# Altium project Powermodule-v7.0.3.PrjPcb (part 2 of 2)

## Sheet Power_Section.SchDoc
size 420 x 297 mm; SheetNumber: 2; SheetTotal: 6
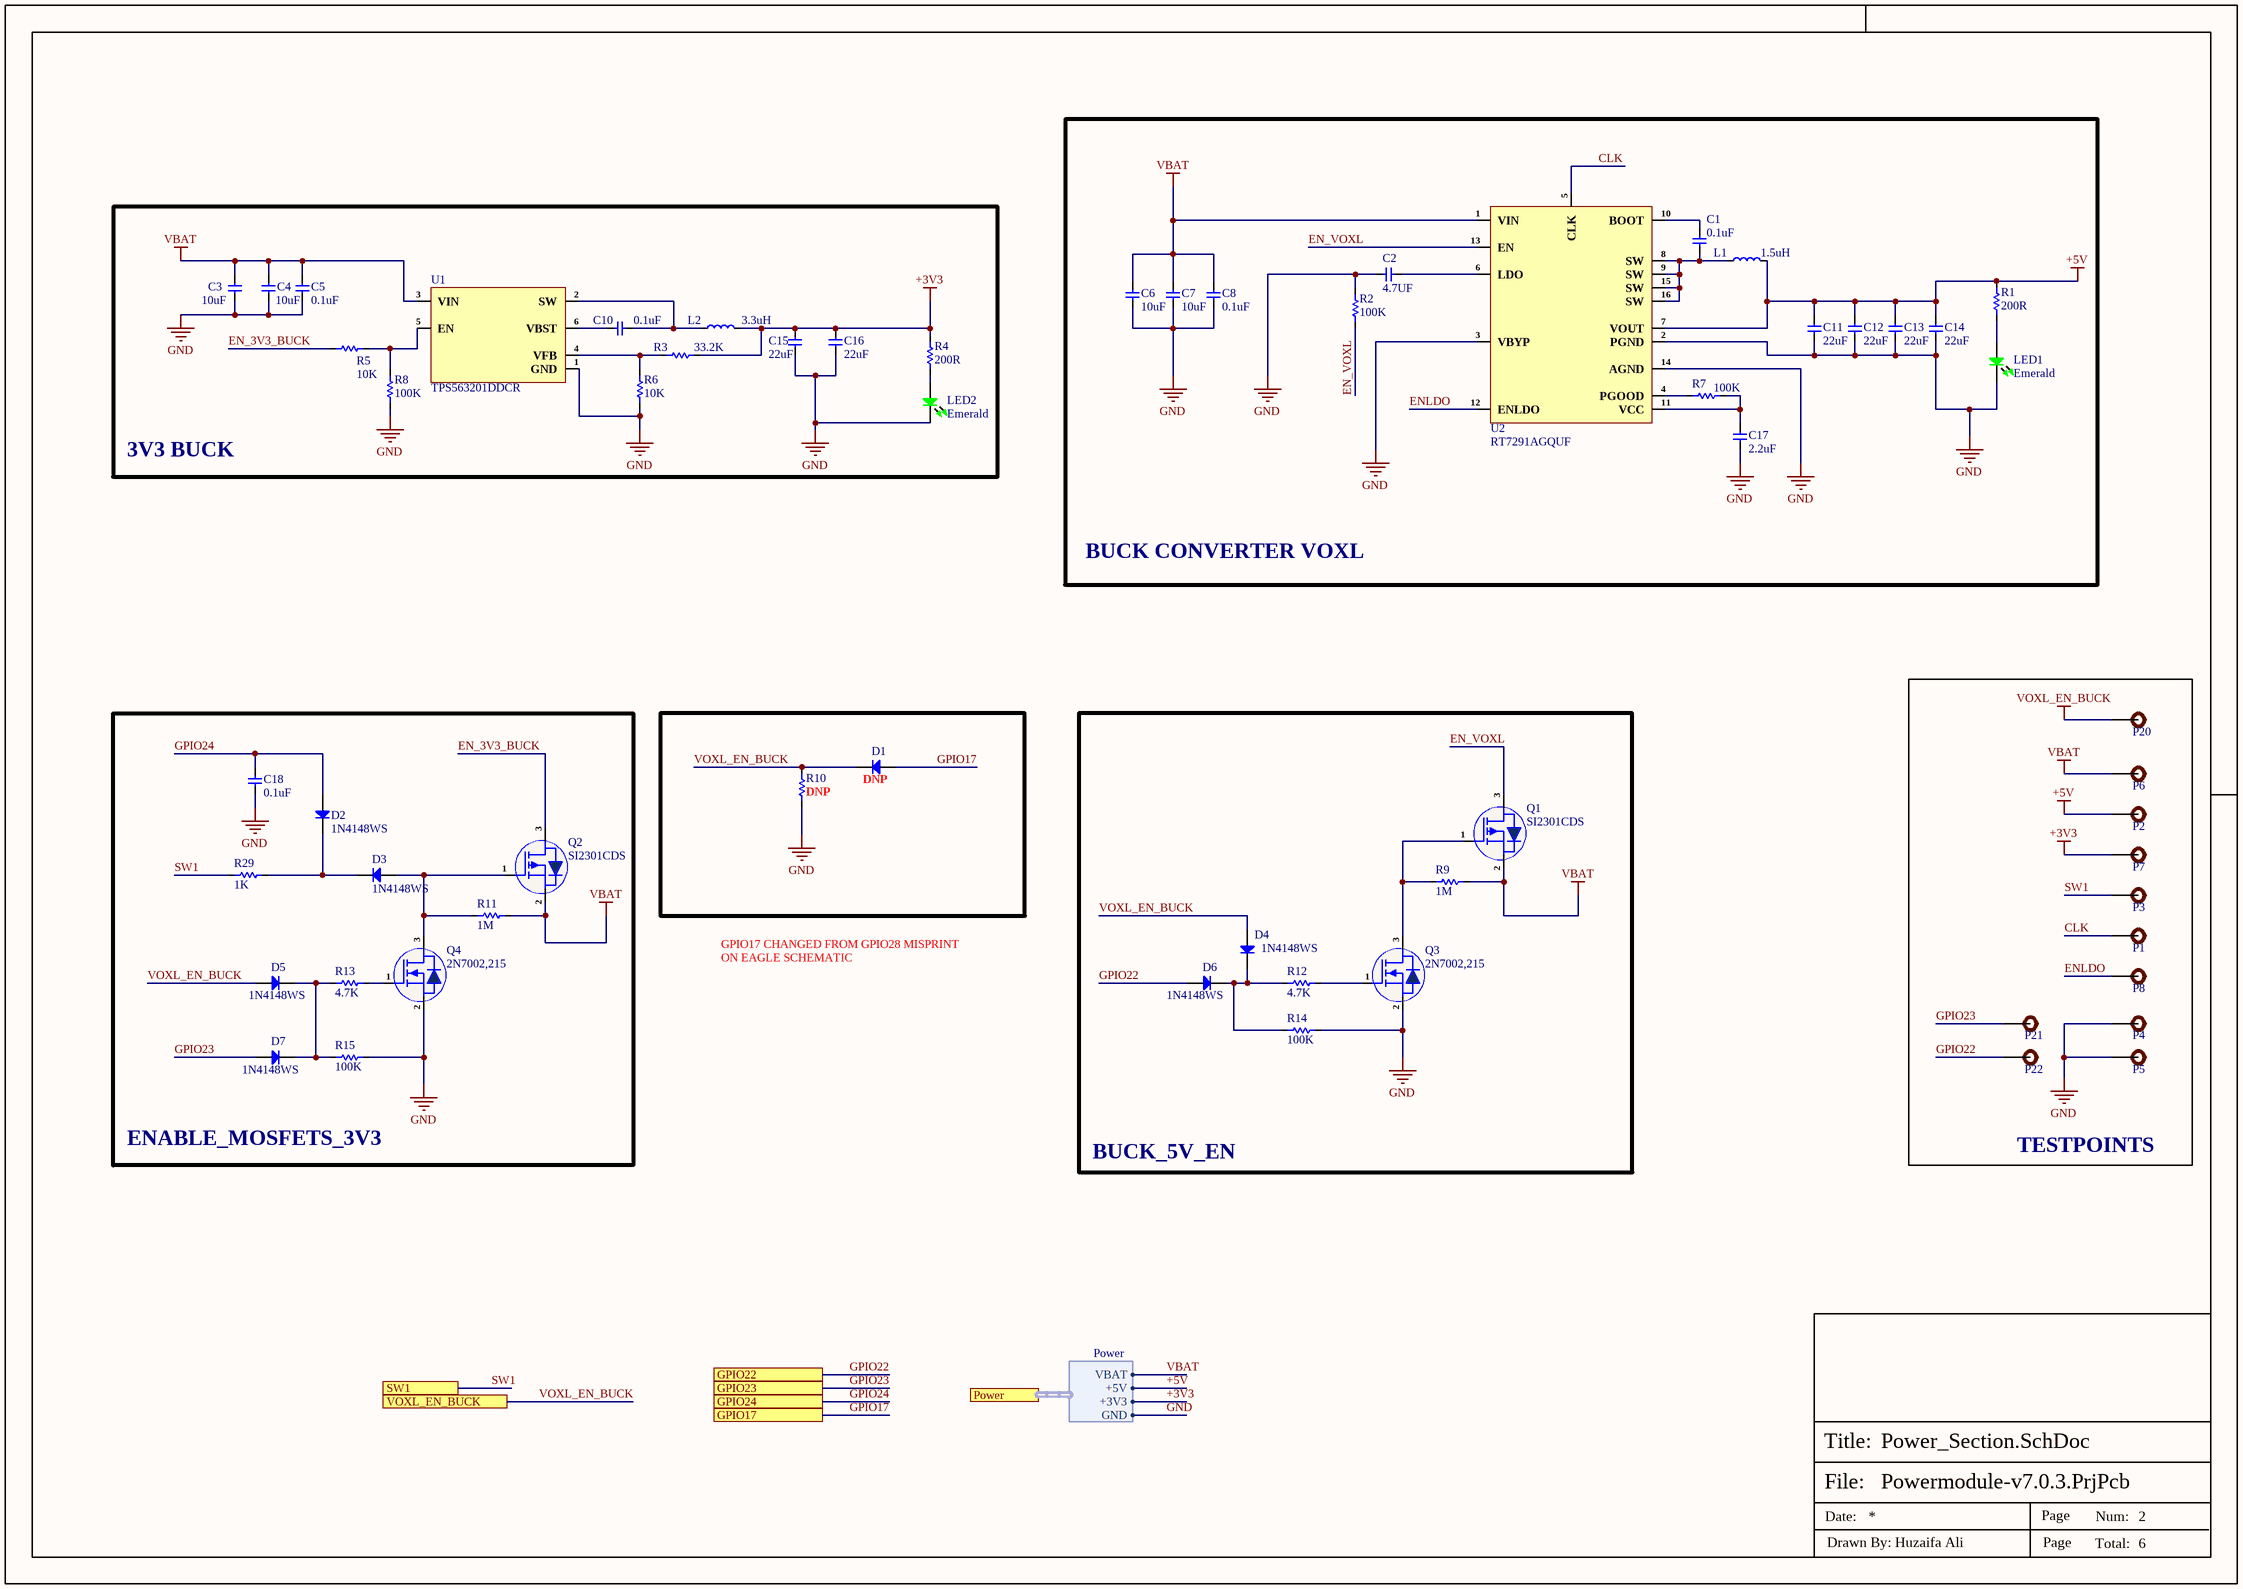
[diagram p4: Power_Section.SchDoc]

### Parts
C1  0.1uF  [Cap-0603]
C2  4.7UF  [Cap-0603]
C3  10uF  [Cap-0603]
C4  10uF  [Cap-0603]
C5  0.1uF  [Cap-0603]
C6  10uF  [Cap-0603]
C7  10uF  [Cap-0603]
C8  0.1uF  [Cap-0603]
C10  0.1uF  [Cap-0603]
C11  22uF  [Cap-0603]
C12  22uF  [Cap-0603]
C13  22uF  [Cap-0603]
C14  22uF  [Cap-0603]
C15  22uF  [Cap-0603]
C16  22uF  [Cap-0603]
C17  2.2uF  [CAP-0603]
C18  0.1uF  [Cap-0603]
D1  DNP  [SOD-323]
D2  1N4148WS  [SOD-323]
D3  1N4148WS  [SOD-323]
D4  1N4148WS  [SOD-323]
D5  1N4148WS  [SOD-323]
D6  1N4148WS  [SOD-323]
D7  1N4148WS  [SOD-323]
L1  1.5uH  [HA72L-06301R5LFTR]
L2  3.3uH  [VLS3012HBX-3R3M]
LED1  Emerald  [LED-0603]
LED2  Emerald  [LED-0603]
P1  TEST POINT  [Test-point]  (value not drawn)
P2  TEST POINT  [Test-point]  (value not drawn)
P3  TEST POINT  [Test-point]  (value not drawn)
P4  TEST POINT  [Test-point]  (value not drawn)
P5  TEST POINT  [Test-point]  (value not drawn)
P6  TEST POINT  [Test-point]  (value not drawn)
P7  TEST POINT  [Test-point]  (value not drawn)
P8  TEST POINT  [Test-point]  (value not drawn)
P20  TEST POINT  [Test-point]  (value not drawn)
P21  TEST POINT  [Test-point]  (value not drawn)
P22  TEST POINT  [Test-point]  (value not drawn)
Q1  SI2301CDS  [SOT-23]
Q2  SI2301CDS  [SOT-23]
Q3  2N7002,215  [SOT-23]
Q4  2N7002,215  [SOT-23]
R1  200R  [Res-0603]
R2  100K  [Res-0603]
R3  33.2K  [Res-0603]
R4  200R  [Res-0603]
R5  10K  [Res-0603]
R6  10K  [Res-0603]
R7  100K  [Res-0603]
R8  100K  [Res-0603]
R9  1M  [Res-0603]
R10  DNP  [Res-0201]
R11  1M  [Res-0603]
R12  4.7K  [Res-0603]
R13  4.7K  [Res-0603]
R14  100K  [Res-0603]
R15  100K  [Res-0603]
R29  1K  [Res-0603]
U1  TPS563201DDCR  [SOT-23-6 THIN]
U2  RT7291AGQUF  [QFN-16(3x3) RT7291AGQUF]

### Blocks framed on the sheet
BUCK CONVERTER VOXL: C1 C2 C6-C8 C11-C14 C17 L1 LED1 R1 R2 R7 U2
3V3 BUCK: C3-C5 C10 C15 C16 L2 LED2 R3-R6 R8 U1
TESTPOINTS: P1-P8 P20-P22
ENABLE_MOSFETS_3V3: C18 D2 D3 D5 D7 Q2 Q4 R11 R13 R15 R29
BUCK_5V_EN: D4 D6 Q1 Q3 R9 R12 R14

### Ports
GPIO17 (see Top-Sheet[2C], Controller_Section[1D]), GPIO22 (see Top-Sheet[2C], Controller_Section[1D]), GPIO23 (see Top-Sheet[2C], Controller_Section[1D]), GPIO24 (see Top-Sheet[2C], Controller_Section[1D]), Power (harness Power, see Top-Sheet[1C], Connector_Section[4D], Controller_Section[2D], FlashMemory_Section[1D], WiFiModule_Section[2D]), SW1 (see Top-Sheet[1C], Connector_Section[1D]), VOXL_EN_BUCK (see Top-Sheet[1C], Connector_Section[2D])

### Harnesses
Power: +5V, +3V3, GND, VBAT

### Nets
+3V3: C15.2 C16.2 L2.2 P7.1 R3.2 R4.2 ; port Power.+3V3
+5V: C11.2 C12.2 C13.2 C14.2 L1.2 P2.1 R1.2 U2.7(VOUT) ; port Power.+5V
GND: C2.1 C3.1 C4.1 C5.1 C6.1 C7.1 C8.1 C11.1 C12.1 C13.1 C14.1 C15.1 C16.1 C17.1 C18.1 LED1.2 LED2.2 P4.1 P5.1 Q3.2(S) Q4.2(S) R2.2 R6.2 R8.1 R10.1 R14.2 R15.2 U1.1(GND) U2.2(PGND) U2.3(VBYP) U2.14(AGND) ; port Power.GND
VBAT: C3.2 C4.2 C5.2 C6.2 C7.2 C8.2 P6.1 Q1.2(S) Q2.2(S) R9.2 R11.2 U1.3(VIN) U2.1(VIN) ; port Power.VBAT
VOXL_EN_BUCK: D1.1(K) D4.2(A) D5.2(A) P20.1 R10.2 ; port VOXL_EN_BUCK
CLK: P1.1 U2.5(CLK)
EN_3V3_BUCK: Q2.3(D) R5.1
EN_VOXL: Q1.3(D) R2.1 U2.13(EN)
ENLDO: P8.1 U2.12(ENLDO)
GPIO17: D1.2(A) ; port GPIO17
GPIO22: D6.2(A) P22.1 ; port GPIO22
GPIO23: D7.2(A) P21.1 ; port GPIO23
GPIO24: C18.2 D2.2(A) ; port GPIO24
SW1: P3.1 R29.1 ; port SW1
NetC1_1: C1.1 L1.1 U2.8(SW) U2.9(SW) U2.15(SW) U2.16(SW)
NetC1_2: C1.2 U2.10(BOOT)
NetC2_2: C2.2 U2.6(LDO)
NetC10_1: C10.1 L2.1 U1.2(SW)
NetC10_2: C10.2 U1.6(VBST)
NetC17_2: C17.2 R7.2 U2.11(VCC)
NetD2_1: D2.1(K) D3.1(K) R29.2
NetD3_2: D3.2(A) Q2.1(G) Q4.3(D) R11.1
NetD4_1: D4.1(K) D6.1(K) R12.1 R14.1
NetD5_1: D5.1(K) D7.1(K) R13.1 R15.1
NetLED1_1: LED1.1 R1.1
NetLED2_1: LED2.1 R4.1
NetQ1_1: Q1.1(G) Q3.3(D) R9.1
NetQ3_1: Q3.1(G) R12.2
NetQ4_1: Q4.1(G) R13.2
NetR3_1: R3.1 R6.1 U1.4(VFB)
NetR5_2: R5.2 R8.2 U1.5(EN)
NetR7_1: R7.1 U2.4(PGOOD)

### Notes on the sheet
- GPIO17 CHANGED FROM GPIO28 MISPRINT ON EAGLE SCHEMATIC
- File:
- Title:
- Date:
- Page
- Num:
- Total:
- Drawn By: Huzaifa Ali

### Library data of the parts
C1 C5 C8 C10 C18 = CL10B104KB8NNNC: CAP CER 0.1UF 50V X7R 0603; Manufacturer: Samsung; Material: Ceramic; Capacitance: 100nF; Tolerance: 10%; Supplier 1: Digi-Key; Manufacturer Part Number: CL10B104KB8NNNC; RoHS: Yes; Category: Ceramic Capacitors; Stock 1: 3998791; Pricing 1: 1=0.10000, 10=0.03000, 50=0.01640, 100=0.01340, 500=0.00954, 1000=0.00750 (USD); Mount: Surface Mount; Case/Package: 0603; Case Code (Metric): 1608; Case Code (Imperial): 0603; Contact Plating: Tin; Min Operating Temperature: -55°C; Max Operating Temperature: 125°C; Dielectric: X7R; Voltage Rating: 50V; Package Quantity: 1; Packaging: Tape and Reel; Voltage: 50V; Voltage Rating (DC): 50V; Series: CL; Construction: Flat; Length: 1.6mm; Width: 0.031inch; Height: 0.8mm; Depth: 0.8mm; Thickness: 0.035inch; Radiation Hardening: No; Lead Free: Lead Free; RoHS Compliant: Yes; ComponentLink1URL: https://datasheet.ciiva.com/25803/cl10b104kb8nnnc-25803393.pdf?src-supplier=Digi-Key; ComponentLink1Description: https://datasheet.ciiva.com/25803/cl10b104kb8nnnc-25803393.pdf?src-supplier=Digi-Key; ComponentLink2URL: https://datasheet.ciiva.com/26838/getdatasheetpartid-89097-26838411.pdf?src-supplier=Verical; ComponentLink2Description: https://datasheet.ciiva.com/26838/getdatasheetpartid-89097-26838411.pdf?src-supplier=Verical; ComponentLink3URL: https://datasheet.ciiva.com/29198/456651-da-01-en-vs-kondensator-0605-29198839.pdf?src-supplier=Conrad; ComponentLink3Description: https://datasheet.ciiva.com/29198/456651-da-01-en-vs-kondensator-0605-29198839.pdf?src-supplier=Conrad; Supplier Part Number 1: 1276-1000-1-ND; LCSC Part Number: C1591
C2 = CL10A475KA8NQNC: CAP CER 4.7UF 25V X5R 0603; Manufacturer: Samsung; Tolerance: 10%; Supplier 1: Digi-Key; Manufacturer Part Number: CL10A475KA8NQNC; Stock 1: 2252340; Pricing 1: 1=0.37, 10=0.255, 100=0.1528, 500=0.11456, 1000=0.09675 (USD); Mount: Surface Mount; Case/Package: 0603; Case Code (Metric): 1608; Case Code (Imperial): 0603; Contact Plating: Tin; Min Operating Temperature: -55°C; Max Operating Temperature: 85°C; Package Quantity: 1; Packaging: Tape and Reel; Capacitance: 4.7uF; Voltage Rating: 25V; Dielectric: X5R; Termination: Wraparound; Length: 1.6mm; Width: 0.031inch; Thickness: 0.035inch; Depth: 0.8mm; Lead Free: Lead Free; ComponentLink1URL: http://www.samsungsem.com/kr/support/product-search/mlcc/CL10A475KA8NQNC.jsp?src-supplier=Digi-Key; ComponentLink1Description: http://www.samsungsem.com/kr/support/product-search/mlcc/CL10A475KA8NQNC.jsp?src-supplier=Digi-Key; Supplier Part Number 1: 1276-1900-1-ND; LCSC Part Number: C69335
C3 C4 C6 C7 = GRM188R61E106KA73D: CAP CER 10UF 25V X5R 0603; Manufacturer: Murata; Supplier 1: Mouser; Manufacturer Part Number: GRM188R61E106KA73D; RoHS: Yes; Category: Ceramic Capacitors; Stock 1: 319428; Pricing 1: 1=0.36000, 10=0.25800, 50=0.25800, 100=0.15500, 1000=0.09800, 10000=0.06900 (USD); Case/Package: 0603; RoHS Compliant: Yes; ComponentLink1URL: https://search.murata.co.jp/Ceramy/image/img/A01X/G101/ENG/GRM188R61E106KA73-01.pdf?src-supplier=Digi-Key; ComponentLink1Description: https://search.murata.co.jp/Ceramy/image/img/A01X/G101/ENG/GRM188R61E106KA73-01.pdf?src-supplier=Digi-Key; Supplier Part Number 1: 81-GRM188R61E106KA3D; LCSC Part Number: C344022
C11-C16 = CC0603MRX5R6BB226: CAP CER 22UF 10V X5R 0603; Manufacturer: Yageo; Tolerance: 20%; Item Type: Capacitor; Supplier 1: Digi-Key; Manufacturer Part Number: CC0603MRX5R6BB226; RoHS: Yes; Category: Ceramic Capacitors; Stock 1: 19628; Pricing 1: 1=0.68000, 10=0.48000, 50=0.36300, 100=0.31610, 500=0.23416, 1000=0.19903 (USD); Mount: Surface Mount; Case/Package: 0603; Case Code (Metric): 1608; Case Code (Imperial): 0603; Weight: 7.1E-05oz; Min Operating Temperature: -55°C; Max Operating Temperature: 85°C; Packaging: Tape and Reel; Capacitance: 22uF; Voltage Rating: 10V; Dielectric: X5R; Termination: SMD/SMT; Voltage Rating (DC): 10V; Package Quantity: 4000; Length: 0.063inch; Width: 0.8mm; Height: 0.8mm; Thickness: 0.035inch; Lead Free: Lead Free; Halogen Free: Halogen Free; RoHS Compliant: Yes; ComponentLink1URL: http://www.mouser.com/ds/2/447/Yageo_UPY-GP_NP0_16V-to-50V_9-358835.pdf?src-supplier=Mouser; ComponentLink1Description: http://www.mouser.com/ds/2/447/Yageo_UPY-GP_NP0_16V-to-50V_9-358835.pdf?src-supplier=Mouser; ComponentLink2URL: http://www.yageo.com/documents/recent/UPY-GPHC_X5R_4V-to-50V_25.pdf?src-supplier=Digi-Key; ComponentLink2Description: http://www.yageo.com/documents/recent/UPY-GPHC_X5R_4V-to-50V_25.pdf?src-supplier=Digi-Key; Supplier Part Number 1: 311-1819-1-ND; LCSC Part Number: C109447
C17 = CC0603KRX5R8BB225: CAP CER 2.2UF 25V X5R 0603; Manufacturer: Yageo; Tolerance: 10%; Item Type: Capacitor; Supplier 1: Digi-Key; Manufacturer Part Number: CC0603KRX5R8BB225; Stock 1: 687936; Pricing 1: 1=0.4, 10=0.276, 50=0.1932, 100=0.1656, 500=0.1242, 1000=0.10488 (USD); Mount: Surface Mount; Case/Package: 0603; Case Code (Metric): 1608; Case Code (Imperial): 0603; Weight: 7.1E-05oz; Min Operating Temperature: -55°C; Max Operating Temperature: 85°C; Packaging: Tape and Reel; Capacitance: 2.2uF; Dielectric: X5R; Voltage Rating: 25V; Termination: SMD/SMT; Resistor Type: Ceramic; Voltage Rating (DC): 25V; Package Quantity: 4000; Length: 1.6mm; Width: 0.031inch; Thickness: 0.037inch; Depth: 0.8mm; Radiation Hardening: No; Lead Free: Lead Free; Halogen Free: Halogen Free; RoHS Compliant: Yes; ComponentLink1URL: https://www.verical.com/server-webapp/html/getDatasheet?partID=782757&src-supplier=Verical; ComponentLink1Description: https://www.verical.com/server-webapp/html/getDatasheet?partID=782757&src-supplier=Verical; Supplier Part Number 1: 311-1786-1-ND; LCSC Part Number: C309478
D1-D7 = 1N4148WS: 75V 200mW Single 1.25V@150mA 4ns 150mA SOD-323 Switching Diode ROHS; Manufacturer: Guangdong Hottech; Manufacturer Part Number: 1N4148WS; Package: SOD-323; LCSC Part Number: C181133; Item Type: Diode
L1 = HA72L-06301R5LFTR: Power Inductors - SMD 1.5uH +/-20% @0A AEC-Q200; Manufacturer: TT BI; Supplier: Farnell; Supplier Part Number: 2932065; Manufacturer Part Number: HA72L-06301R5LFTR; RoHS: No; Category: Fixed Inductors
L2 = VLS3012HBX-3R3M: FIXED IND 3.3UH 2.63A 150MOHM SM; Manufacturer: TDK; Core Material: Metal; Tolerance: 20%; Saturation Current: 2.82A; Shielding: Shielded; DC Resistance (DCR): 150mR; Test Frequency: 1MHz; Supplier: Digi-Key; Supplier Part Number: 445-175070-1-ND; Manufacturer Part Number: VLS3012HBX-3R3M; RoHS: Yes; Category: Fixed Inductors; Stock: 9595; Pricing: 1=0.6, 10=0.512, 25=0.4692, 50=0.4264, 100=0.3795, 250=0.3582, 500=0.30702, 1000=0.27291 (USD); Mounting Technology: Surface Mount; Case/Package: Nonstandard; Min Operating Temperature: -40°C; Max Operating Temperature: 105°C; Packaging: Cut Tape; Value: 3.3uH; Current Rating: 2.63A; Series: VLS-HBX; RoHS Compliant: Yes; ComponentLink1URL: http://www.farnell.com/datasheets/2724074.pdf?src-supplier=Farnell; ComponentLink1Description: http://www.farnell.com/datasheets/2724074.pdf?src-supplier=Farnell; ComponentLink2URL: https://product.tdk.com/info/en/catalog/datasheets/inductor_commercial_power_vls3012hbx_en.pdf?src-supplier=Digi-Key; ComponentLink2Description: https://product.tdk.com/info/en/catalog/datasheets/inductor_commercial_power_vls3012hbx_en.pdf?src-supplier=Digi-Key; ComponentLink3URL: https://product.tdk.com/info/en/catalog/datasheets/inductor_commercial_power_vls3012hbx_en.pdf?ref_disty=digikey&src-supplier=Digi-Key; ComponentLink3Description: https://product.tdk.com/info/en/catalog/datasheets/inductor_commercial_power_vls3012hbx_en.pdf?ref_disty=digikey&src-supplier=Digi-Key; ComponentLink4URL: http://www.farnell.com/datasheets/2724074.pdf?src-supplier=Newark; ComponentLink4Description: http://www.farnell.com/datasheets/2724074.pdf?src-supplier=Newark
LED1 LED2 = NCD0603G2: Emerald 0603 Light Emitting Diodes (LED) ROHS; Manufacturer: Foshan NationStar Optoelectronics; Manufacturer Part Number: NCD0603G2; Package: 0603; LCSC Part Number: C87326; Item Type: LED; ComponentLink1Description: LCSC; ComponentLink1URL: https://www.lcsc.com/product-detail/Light-Emitting-Diodes-LED_Foshan-NationStar-Optoelectronics-NCD0603G2_C87326.html
P1-P8 P20-P22 = TEST POINT: Test Point ON; Item Type: TEST POINT; Manufacturer Part Number: TEST POINT
Q1 Q2 = SI2301CDS: null 3A 400mW 112mΩ@4.5V,2.8A 1V@250uA P Channel SOT-23 MOSFETs ROHS; Manufacturer: FUXINSEMI; Manufacturer Part Number: SI2301CDS; LCSC Part Number: C5290223; Item Type: SOT-23; ComponentLink1Description: LCSC; ComponentLink1URL: https://www.lcsc.com/product-detail/MOSFETs_FUXINSEMI-SI2301CDS_C5290223.html; Package: MOSFET
Q3 Q4 = 2N7002,215: MOSFET N-CH 60V 300MA TO236AB; Manufacturer: Nexperia USA; Supplier: Arrow Electronics; Supplier Part Number: 2N7002,215; Manufacturer Part Number: 2N7002,215; RoHS: No; Category: Uncategorized; ComponentLink1URL: http://www.farnell.com/datasheets/1499179.pdf?src-supplier=Farnell; ComponentLink1Description: http://www.farnell.com/datasheets/1499179.pdf?src-supplier=Farnell; ComponentLink2URL: https://assets.nexperia.com/documents/data-sheet/2N7002.pdf?src-supplier=Digi-Key; ComponentLink2Description: https://assets.nexperia.com/documents/data-sheet/2N7002.pdf?src-supplier=Digi-Key; ComponentLink3URL: http://www.farnell.com/datasheets/1499179.pdf?src-supplier=Newark; ComponentLink3Description: http://www.farnell.com/datasheets/1499179.pdf?src-supplier=Newark
R1 R4 = RT0603DRD07200RL: RES SMD 200 OHM 0.5% 1/10W 0603; Manufacturer: Yageo; Power Rating: 100mW; Voltage Rating (DC): 50V; Supplier 1: Digi-Key; Manufacturer Part Number: RT0603DRD07200RL; Stock 1: 19572; Pricing 1: 1=0.21, 10=0.174, 100=0.0682, 1000=0.02855, 2500=0.02617 (USD); Case/Package: 0603; Resistance: 200R; Tolerance: 0.5%; Packaging: Cut Tape; Lead Free: Lead Free; Supplier Part Number 1: 311-200DCT-ND; LCSC Part Number: C700498
R2 R7 R8 R14 R15 = RC0603JR-07100KL: RES 100K OHM 5% 1/10W 0603; Manufacturer: Yageo; Resistance: 100kR; Temperature Coefficient: 100ppm/°C; Voltage Rating: 50V; Power Rating: 100mW; Item Type: Resistor; Supplier 1: Digi-Key; Manufacturer Part Number: RC0603JR-07100KL; RoHS: Yes; Category: Chip SMD Resistors; Stock 1: 1210037; Pricing 1: 1=0.10000, 10=0.02000, 100=0.00800, 1000=0.00360, 2500=0.00312 (USD); Case/Package: 0603; Number of Pins: 2; Contact Plating: Tin,Matte; Case Code (Imperial): 0603; Case Code (Metric): 1608; Size Code: 0603; Min Operating Temperature: -55°C; Max Operating Temperature: 155°C; Tolerance: 5%; Resistor Type: Thick Film; Packaging: Tape and Reel; Voltage Rating (DC): 50V; Termination: SMD/SMT; Features: Moisture Resistant; Series: RC; Max Power Dissipation: 100mW; Number of Terminations: 2; Resistance Tolerance: 5%; Width: 0.8mm; Radiation Hardening: No; REACH SVHC: No SVHC; Lead Free: Lead Free; RoHS Compliant: Yes; ComponentLink1URL: https://datasheet.ciiva.com/7746/443971-7746424.pdf?src-supplier=Element14; ComponentLink1Description: https://datasheet.ciiva.com/7746/443971-7746424.pdf?src-supplier=Element14; ComponentLink2URL: https://datasheet.ciiva.com/7983/443971-7983686.pdf?src-supplier=Element14; ComponentLink2Description: https://datasheet.ciiva.com/7983/443971-7983686.pdf?src-supplier=Element14; ComponentLink3URL: https://datasheet.ciiva.com/7746/443971-7746423.pdf?src-supplier=Element14; ComponentLink3Description: https://datasheet.ciiva.com/7746/443971-7746423.pdf?src-supplier=Element14; ComponentLink4URL: https://datasheet.ciiva.com/8887/pyu-rc0603-51-rohs-l-4-8887903.pdf?src-supplier=Avnet; ComponentLink4Description: https://datasheet.ciiva.com/8887/pyu-rc0603-51-rohs-l-4-8887903.pdf?src-supplier=Avnet; Supplier Part Number 1: 311-100KGRCT-ND; LCSC Part Number: C100048
R3 = RC0603FR-0733K2L: RES 33.2K OHM 1% 1/10W 0603; Manufacturer: Yageo; Resistance: 33.2kR; Power Rating: 100mW; Voltage Rating: 50V; Temperature Coefficient: 100ppm/°C; Supplier 1: Digi-Key; Manufacturer Part Number: RC0603FR-0733K2L; RoHS: Yes; Category: Chip SMD Resistors; Stock 1: 1293262; Pricing 1: 1=0.10000, 10=0.02300, 100=0.00930, 1000=0.00417, 2500=0.00362 (USD); Mount: Surface Mount; Case/Package: 0603; Case Code (Imperial): 0603; Case Code (Metric): 1608; Size Code: 0603; Min Operating Temperature: -55°C; Max Operating Temperature: 155°C; Tolerance: 1%; Packaging: Tape and Reel; Termination: SMD/SMT; Resistor Type: Thick Film; Voltage Rating (DC): 50V; Features: Moisture Resistant; Series: RC; Max Power Dissipation: 100mW; Number of Terminations: 2; Construction: Rectangular; Technology: THICK FILM; Length: 1.6mm; Height: 0.45mm; Depth: 0.8mm; Military Standard: Not; Lead Free: Lead Free; RoHS Compliant: Yes; ComponentLink1URL: https://datasheet.ciiva.com/11808/0900766b80f96399-11808316.pdf?src-supplier=RSComponents; ComponentLink1Description: https://datasheet.ciiva.com/11808/0900766b80f96399-11808316.pdf?src-supplier=RSComponents; Supplier Part Number 1: 311-33.2KHRCT-ND; LCSC Part Number: C185338
R5 R6 = RT0603BRD0710KL: RES SMD 10K OHM 0.1% 1/10W 0603; Manufacturer: Yageo; Power: 100mW; Rated Temperature: 70°C; Value: 10kR; Temperature Coefficient: 25ppm/°C; Working Voltage: 75V; Package Height: 0.45mm; Package Length: 1.6mm; Package Width: 0.8mm; Item Type: Resistor; Supplier 1: Rs; Manufacturer Part Number: RT0603BRD0710KL; RoHS: Yes; Category: Chip SMD Resistors; Stock 1: 20510; Pricing 1: 100=0.29800, 250=0.27800, 500=0.25900, 1000=0.23700 (GBP); Mounting Technology: Surface Mount; Pins: 2; Case/Package: 0603; Min Operating Temperature: -55°C; Max Operating Temperature: 155°C; Tolerance: 0.1%; Resistor Type: FIXED RESISTOR; Construction: Chip; Package Style: SMTMeter; Packaging: Tape and Reel; Technology: THIN FILM; Termination: Wraparound; Reach SVHC Compliant: Yes; RoHS Compliant: Yes; ComponentLink1URL: https://datasheet.ciiva.com:443/pdfs/VipMasterIC/IC/YAGO/YAGO-S-A0008510989/YAGO-S-A0008510989-1.pdf?src-supplier=IHS+Markit; ComponentLink1Description: https://datasheet.ciiva.com:443/pdfs/VipMasterIC/IC/YAGO/YAGO-S-A0008510989/YAGO-S-A0008510989-1.pdf?src-supplier=IHS+Markit; ComponentLink2URL: https://datasheet.ciiva.com/5624/pyu-rt-1-to-0-05-rohs-l-4-5624351.pdf?src-supplier=Mouser; ComponentLink2Description: https://datasheet.ciiva.com/5624/pyu-rt-1-to-0-05-rohs-l-4-5624351.pdf?src-supplier=Mouser; ComponentLink3URL: https://datasheet.ciiva.com/29721/pyu-rt-1-to-0-05-rohs-l-4-29721177.pdf?src-supplier=Digi-Key; ComponentLink3Description: https://datasheet.ciiva.com/29721/pyu-rt-1-to-0-05-rohs-l-4-29721177.pdf?src-supplier=Digi-Key; Supplier Part Number 1: 1991391P; LCSC Part Number: C95204
R9 R11 = RC0603FR-071ML: RES SMD 1M OHM 1% 1/10W 0603; Manufacturer: Yageo; Voltage Rating: 50V; Resistance: 1MR; Power Rating: 100mW; Temperature Coefficient: 100ppm/°C; Item Type: Resistor; Supplier 1: Digi-Key; Manufacturer Part Number: RC0603FR-071ML; Stock 1: 3824601; Pricing 1: 1=0.1, 10=0.023, 100=0.0094, 1000=0.00421, 2500=0.00366 (USD); Case/Package: 0603; Number of Pins: 2; Case Code (Imperial): 0603; Case Code (Metric): 1608; Min Operating Temperature: -55°C; Max Operating Temperature: 155°C; Voltage Rating (DC): 50V; Tolerance: 1%; Packaging: Tape and Reel; Package Quantity: 5000; Termination: SMD/SMT; Composition: Thick Film; Military Standard: Not; Length: 1.6mm; Height: 0.45mm; Width: 0.8mm; Depth: 0.8mm; REACH SVHC: No SVHC; Lead Free: Lead Free; ComponentLink1URL: http://www.farnell.com/datasheets/2167052.pdf?src-supplier=Mouser; ComponentLink1Description: http://www.farnell.com/datasheets/2167052.pdf?src-supplier=Mouser; ComponentLink2URL: http://www.farnell.com/datasheets/2167052.pdf?src-supplier=Element14; ComponentLink2Description: http://www.farnell.com/datasheets/2167052.pdf?src-supplier=Element14; ComponentLink3URL: http://documents.rs-components.com/techlib://itc_doclist_GB.htm?stockno=5048956&src-supplier=RSComponents; ComponentLink3Description: http://documents.rs-components.com/techlib://itc_doclist_GB.htm?stockno=5048956&src-supplier=RSComponents; Supplier Part Number 1: 311-1.00MHRDKR-ND; LCSC Part Number: C105578
R10 = RC0201FR-0710KL: RES SMD 10K OHM 1% 1/20W 0201; Manufacturer: Yageo; Item Type: Resistor; Manufacturer Part Number: RC0201FR-0710KL; Package: 0201; ComponentLink7Description: LCSC; ComponentLink7URL: https://www.lcsc.com/product-detail/Chip-Resistor-Surface-Mount_YAGEO-RC0201FR-0710KL_C106225.html; LCSC Part Number: C106225
R12 R13 = RC0603JR-074K7L: RES SMD 4.7K OHM 5% 1/10W 0603; Manufacturer: Yageo; Resistance: 4.7kR; Temperature Coefficient: 100ppm/°C; Voltage Rating (DC): 50V; Power Rating: 100mW; Item Type: Resistor; Supplier 1: Digi-Key; Manufacturer Part Number: RC0603JR-074K7L; Stock 1: 19706643; Pricing 1: 1=0.1, 10=0.02, 100=0.0081, 1000=0.00362, 2500=0.00314 (USD); Case/Package: 0603; Number of Pins: 2; Case Code (Imperial): 0603; Case Code (Metric): 1608; Min Operating Temperature: -55°C; Max Operating Temperature: 155°C; Tolerance: 5%; Composition: Thick Film; Packaging: Tape and Reel; Voltage Rating: 50V; Termination: SMD/SMT; Military Standard: Not; Length: 1.6mm; Width: 0.8mm; Depth: 0.8mm; REACH SVHC: No SVHC; Lead Free: Lead Free; ComponentLink1URL: http://www.farnell.com/datasheets/443971.pdf?src-supplier=Element14; ComponentLink1Description: http://www.farnell.com/datasheets/443971.pdf?src-supplier=Element14; Supplier Part Number 1: 311-4.7KGRCT-ND; LCSC Part Number: C105428
R29 = RT0603DRD071KL: RES SMD 1K OHM 0.5% 1/10W 0603; Manufacturer: Yageo; Resistance: 1kR; Temperature Coefficient: 25ppm/°C; Power Rating: 100mW; Voltage Rating: 75V; Voltage Rating (DC): 50V; Supplier 1: Digi-Key; Manufacturer Part Number: RT0603DRD071KL; Stock 1: 178947; Pricing 1: 1=0.2, 10=0.167, 100=0.0651, 1000=0.02725, 2500=0.02498 (USD); Case/Package: 0603; Contact Plating: Tin,Matte; Case Code (Metric): 1608; Case Code (Imperial): 0603; Min Operating Temperature: -55°C; Max Operating Temperature: 125°C; Tolerance: 0.5%; Composition: Thin Film; Packaging: Tape and Reel; Termination: SMD/SMT; Radiation Hardening: No; Lead Free: Lead Free; ComponentLink1URL: http://www.mouser.com/ds/2/447/yageodocoutput-1125656.pdf?src-supplier=Mouser; ComponentLink1Description: http://www.mouser.com/ds/2/447/yageodocoutput-1125656.pdf?src-supplier=Mouser; ComponentLink2URL: http://www.yageo.com/documents/recent/PYu-RT_1-to-0.05_RoHS_L_6.pdf?src-supplier=Avnet; ComponentLink2Description: http://www.yageo.com/documents/recent/PYu-RT_1-to-0.05_RoHS_L_6.pdf?src-supplier=Avnet; Supplier Part Number 1: 311-1.0KDDKR-ND; LCSC Part Number: C165964
U1 = TPS563201DDCR: IC REG BUCK ADJ 3A TSOT23-6; Manufacturer: Texas Instruments; Number of Outputs: 1; Min Input Voltage: 4.5V; Max Input Voltage: 17V; Min Output Voltage: 768mV; Max Output Voltage: 7V; Switching Frequency: 580kHz; Synchronous Rectifier: Yes; Quiescent Current: 400uA; Output Type: Adjustable; Output Configuration: Positive; Supplier 1: Digi-Key; Manufacturer Part Number: TPS563201DDCR; Stock 1: 0; Pricing 1: 1=0.92, 10=0.812, 25=0.7628, 100=0.5781, 250=0.492, 500=0.4674, 1000=0.3567 (USD); Mount: Surface Mount; Case/Package: SOT-23-6; Number of Pins: 6; Min Operating Temperature: -40°C; Max Operating Temperature: 125°C; Packaging: Tape and Reel; Output Current: 3A; Lead Free: Lead Free; ComponentLink1URL: http://www.ti.com/lit/ds/symlink/tps563201.pdf?src-supplier=Digi-Key; ComponentLink1Description: http://www.ti.com/lit/ds/symlink/tps563201.pdf?src-supplier=Digi-Key; ComponentLink2URL: http://www.ti.com/general/docs/suppproductinfo.tsp?distId=10&amp;gotoUrl=http%3A%2F%2Fwww.ti.com%2Flit%2Fgpn%2Ftps563201&src-supplier=Digi-Key; ComponentLink2Description: http://www.ti.com/general/docs/suppproductinfo.tsp?distId=10&amp;gotoUrl=http%3A%2F%2Fwww.ti.com%2Flit%2Fgpn%2Ftps563201&src-supplier=Digi-Key; ComponentLink3URL: http://www.ti.com/lit/gpn/tps563201?src-supplier=Mouser; ComponentLink3Description: http://www.ti.com/lit/gpn/tps563201?src-supplier=Mouser; Supplier Part Number 1: 296-47238-6-ND; LCSC Part Number: C116592; Item Type: IC
U2 = RT7291AGQUF: Step-down type Fixed 5V 5V~23V 6A QFN-16(3x3) DC-DC Converters ROHS; Manufacturer: Richtek; Item Type: IC; Supplier: Digi-Key; Supplier Part Number: 1028-RT7291AGQUFCT-ND; Manufacturer Part Number: RT7291AGQUF; RoHS: No; Category: Voltage Regulators - Switching; Stock: 1332; Pricing: 1=2.62, 10=2.355, 25=2.222, 100=1.8931, 250=1.7776, 500=1.5554 (USD); LCSC Part Number: C425179

## Sheet WiFiModule_Section.SchDoc
size A4; SheetNumber: 5; SheetTotal: 6
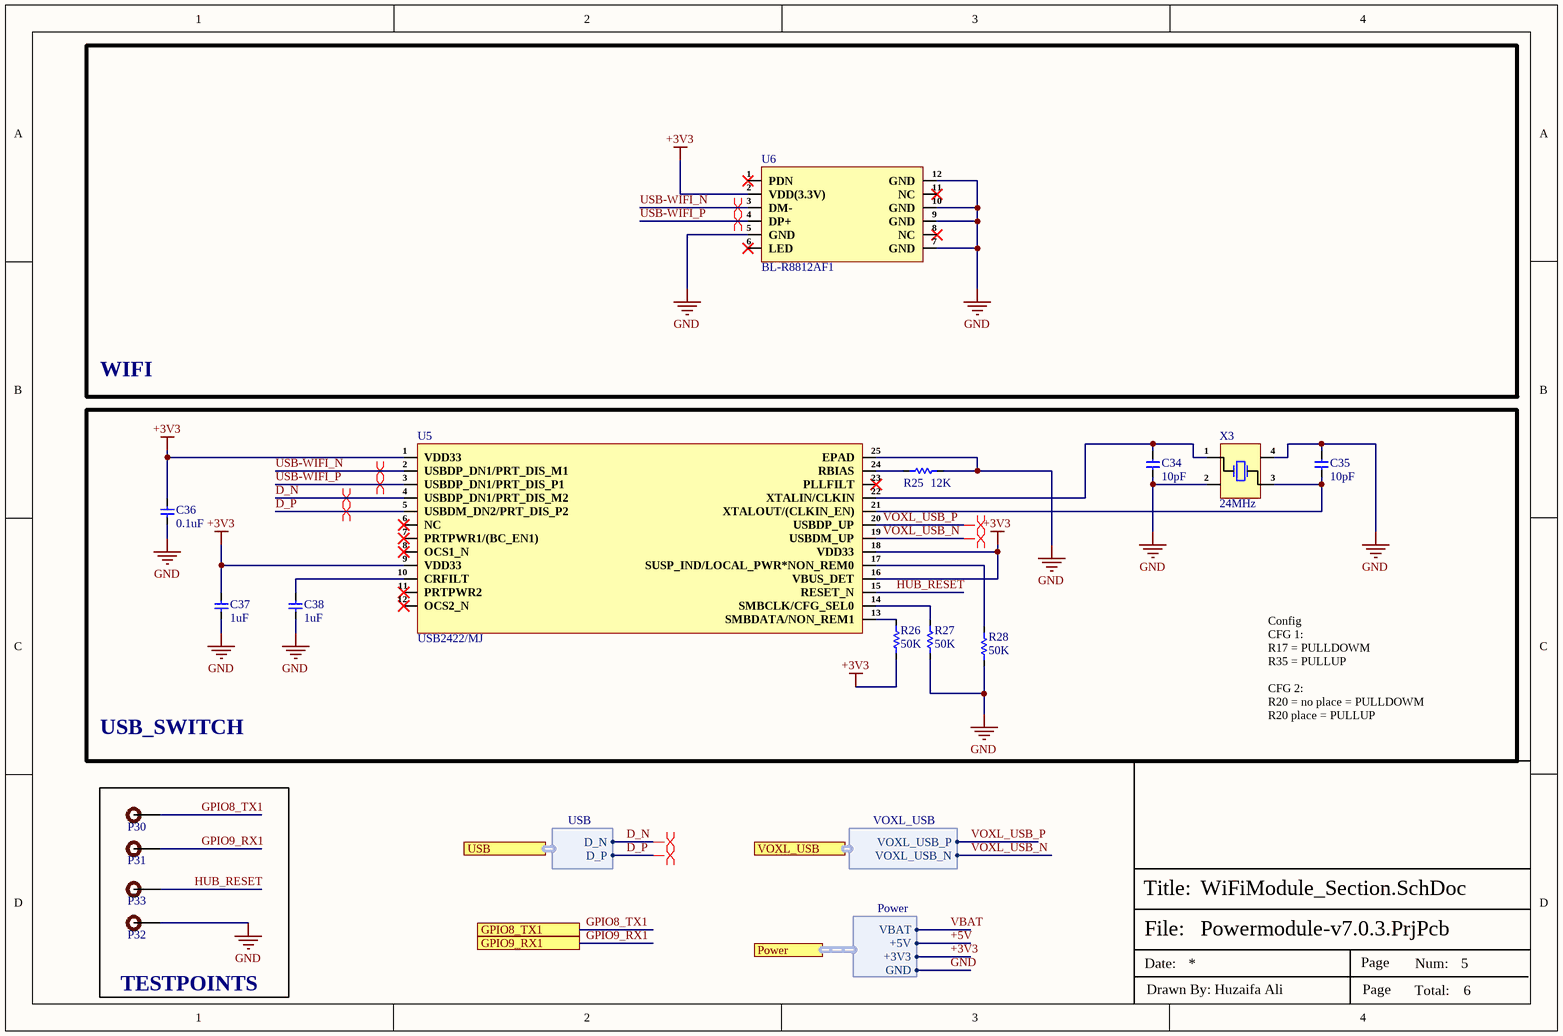
[diagram p5: WiFiModule_Section.SchDoc]

### Parts
C34  10pF  [Cap-0603]
C35  10pF  [Cap-0603]
C36  0.1uF  [Cap-0603]
C37  1uF  [Cap-0603]
C38  1uF  [Cap-0603]
P30  TEST POINT  [Test-point]  (value not drawn)
P31  TEST POINT  [Test-point]  (value not drawn)
P32  TEST POINT  [Test-point]  (value not drawn)
P33  TEST POINT  [Test-point]  (value not drawn)
R25  12K  [Res-0603]
R26  50K  [Res-0603]
R27  50K  [Res-0603]
R28  50K  [Res-0603]
U5  USB2422/MJ  [24-QFN (4x4)]
U6  BL-R8812AF1  [BL-R8812AF1]
X3  24MHz  [MCSJK-7U-24.00-12-10-60-B-10]

### Blocks framed on the sheet
WIFI: U6
USB_SWITCH: C34-C38 R25-R28 U5 X3
TESTPOINTS: P30-P33

### Ports
GPIO8_TX1 (see Top-Sheet[3C], Controller_Section[1D]), GPIO9_RX1 (see Top-Sheet[3C], Controller_Section[1D]), Power (harness Power, see Top-Sheet[3B], Connector_Section[4D], Controller_Section[2D], FlashMemory_Section[1D], Power_Section[3D]), USB (harness USB, see Top-Sheet[3C], Controller_Section[1D]), VOXL_USB (harness VOXL_USB, see Top-Sheet[3C], Connector_Section[2C])

### Harnesses
VOXL_USB: VOXL_USB_P, VOXL_USB_N
USB: D_N, D_P
Power: +5V, +3V3, GND, VBAT

### Nets
+3V3: C36.2 C37.2 R26.1 U5.1(VDD33) U5.9(VDD33) U5.16(VBUS_DET) U5.18(VDD33) U6.2(VDD(3.3V)) ; port Power.+3V3
GND: C34.1 C35.2 C36.1 C37.1 C38.1 P32.1 R25.2 R27.1 R28.1 U5.25(EPAD) U6.5(GND) U6.7(GND) U6.9(GND) U6.10(GND) U6.12(GND) X3.2(GND) X3.4(VDD) ; port Power.GND
D_N: U5.4(USBDP_DN1/PRT_DIS_M2) ; port USB.D_N
D_P: U5.5(USBDM_DN2/PRT_DIS_P2) ; port USB.D_P
GPIO8_TX1: P30.1 ; port GPIO8_TX1
GPIO9_RX1: P31.1 ; port GPIO9_RX1
HUB_RESET: P33.1 U5.15(RESET_N)
USB-WIFI_N: U5.2(USBDP_DN1/PRT_DIS_M1) U6.3(DM-)
USB-WIFI_P: U5.3(USBDP_DN1/PRT_DIS_P1) U6.4(DP+)
VOXL_USB_N: U5.19(USBDM_UP) ; port VOXL_USB.VOXL_USB_N
VOXL_USB_P: U5.20(USBDP_UP) ; port VOXL_USB.VOXL_USB_P
NetC34_2: C34.2 U5.22(XTALIN/CLKIN) X3.1(ENABLE_CONTROL)
NetC35_1: C35.1 U5.21(XTALOUT/(CLKIN_EN)) X3.3(OUT_PUT)
NetC38_2: C38.2 U5.10(CRFILT)
NetR25_1: R25.1 U5.24(RBIAS)
NetR26_2: R26.2 U5.13(SMBDATA/NON_REM1)
NetR27_2: R27.2 U5.14(SMBCLK/CFG_SEL0)
NetR28_2: R28.2 U5.17(SUSP_IND/LOCAL_PWR*NON_REM0)

Not connected (* = marked no-connect by the designer): U5 6(NC)* 7(PRTPWR1/(BC_EN1))* 8(OCS1_N)* 11(PRTPWR2)* 12(OCS2_N)* 23(PLLFILT)*; U6 1(PDN)* 6(LED)* 8(NC)* 11(NC)*

### Layout directives
differential pair; rule Impedance Constraint [Min = 88.00    Max = 102.0    ]; rule Matched Net Lengths [Tolerance = 0.508mm]; net class D; differential pair class D_Lines: D_N, D_P
differential pair; net class USB-WIFI; differential pair class USB_WIFI_Lines; rule Matched Net Lengths [Tolerance = 0.508mm]; rule Impedance Constraint [Min = 88.00    Max = 102.0    ]: USB-WIFI_N, USB-WIFI_P
differential pair; net class VOXL_USB; differential pair class VOXL_USB_Lines; rule Matched Net Lengths [Tolerance = 0.508mm]; rule Impedance Constraint [Min = 88.00    Max = 102.0    ]: VOXL_USB_N, VOXL_USB_P

### Notes on the sheet
- Config
  CFG 1:
  R17 = PULLDOWM
  R35 = PULLUP
  CFG 2:
  R20 = no place = PULLDOWM
  R20 place = PULLUP
- File:
- Title:
- Date:
- Page
- Num:
- Total:
- Drawn By: Huzaifa Ali

### Library data of the parts
C34 C35 = CC0603JRNPO9BN100: CAP CER 10PF 50V C0G/NPO 0603; Manufacturer: Yageo; Tolerance: 5%; Dielectric: C0G; Temperature Coefficient: 30ppm/°C; Insulation Resistance: 100GR; ComponentLink1URL: https://datasheet.ciiva.com/25787/cl10a475ka8nqnc-25787017.pdf?src-supplier=Digi-Key; ComponentLink1Description: https://datasheet.ciiva.com/25787/cl10a475ka8nqnc-25787017.pdf?src-supplier=Digi-Key; ComponentLink2URL: https://datasheet.ciiva.com/144/mlccorderingcode-144651.pdf?src-supplier=Digi-Key; ComponentLink2Description: https://datasheet.ciiva.com/144/mlccorderingcode-144651.pdf?src-supplier=Digi-Key; ComponentLink3URL: https://datasheet.ciiva.com/11786/0900766b8079c870-11786407.pdf?src-supplier=RSComponents; ComponentLink3Description: https://datasheet.ciiva.com/11786/0900766b8079c870-11786407.pdf?src-supplier=RSComponents; ComponentLink4URL: https://datasheet.ciiva.com/5789/1734582-5789616.pdf?src-supplier=Farnell; ComponentLink4Description: https://datasheet.ciiva.com/5789/1734582-5789616.pdf?src-supplier=Farnell; ComponentLink5URL: https://datasheet.ciiva.com/26862/getdatasheetpartid-403524-26862758.pdf?src-supplier=Verical; ComponentLink5Description: https://datasheet.ciiva.com/26862/getdatasheetpartid-403524-26862758.pdf?src-supplier=Verical; ComponentLink6URL: https://datasheet.ciiva.com/7978/1132289-7978126.pdf?src-supplier=Element14; ComponentLink6Description: https://datasheet.ciiva.com/7978/1132289-7978126.pdf?src-supplier=Element14; ComponentLink7URL: https://datasheet.ciiva.com/46430/1835847-46430150.pdf?src-supplier=Element14; ComponentLink7Description: https://datasheet.ciiva.com/46430/1835847-46430150.pdf?src-supplier=Element14; ComponentLink8URL: https://datasheet.ciiva.com/144/mlccorderingcode-144650.pdf?src-supplier=Digi-Key; ComponentLink8Description: https://datasheet.ciiva.com/144/mlccorderingcode-144650.pdf?src-supplier=Digi-Key; ComponentLink9URL: https://datasheet.ciiva.com/144/mlccorderingcode-144649.pdf?src-supplier=Digi-Key; ComponentLink9Description: https://datasheet.ciiva.com/144/mlccorderingcode-144649.pdf?src-supplier=Digi-Key; ComponentLink10URL: https://datasheet.ciiva.com/5425/upy-gp-np0-16v-to-50v-8-5425564.pdf?src-supplier=Mouser; ComponentLink10Description: https://datasheet.ciiva.com/5425/upy-gp-np0-16v-to-50v-8-5425564.pdf?src-supplier=Mouser; ComponentLink11URL: https://datasheet.ciiva.com/8033/1734582-8033710.pdf?src-supplier=Element14; ComponentLink11Description: https://datasheet.ciiva.com/8033/1734582-8033710.pdf?src-supplier=Element14; ComponentLink12URL: https://datasheet.ciiva.com/8033/1734582-8033706.pdf?src-supplier=Element14; ComponentLink12Description: https://datasheet.ciiva.com/8033/1734582-8033706.pdf?src-supplier=Element14; Supplier 1: Digi-Key; Manufacturer Part Number: CC0603JRNPO9BN100; RoHS: Yes; Category: Ceramic Capacitors; Stock 1: 1700978; Pricing 1: 1=0.10000, 10=0.03900, 50=0.02120, 100=0.01740, 500=0.01240, 1000=0.00974 (USD); Mount: Surface Mount; Case/Package: 0603; Number of Pins: 2; Case Code (Metric): 1608; Case Code (Imperial): 0603; Min Operating Temperature: -55°C; Max Operating Temperature: 125°C; Capacitance: 10pF; Voltage: 50V; Voltage Rating: 50V; Voltage Rating (DC): 50V; Packaging: Tape and Reel; Package Quantity: 1; Termination: SMD/SMT; Resistor Type: Ceramic; Series: CC; Length: 1.6mm; Width: 0.031inch; Height: 0.8mm; Thickness: 0.035inch; Depth: 0.8mm; Radiation Hardening: No; RoHS Compliant: Yes; REACH SVHC: No SVHC; Lead Free: Lead Free; Supplier Part Number 1: 311-1058-1-ND; LCSC Part Number: C106245
C36 = CL10B104KB8NNNC: as C1 on sheet Power_Section; Supplier 1: Digi-Key; Manufacturer Part Number: CL10B104KB8NNNC; RoHS: Yes; Category: Ceramic Capacitors; Stock 1: 3998791; Pricing 1: 1=0.10000, 10=0.03000, 50=0.01640, 100=0.01340, 500=0.00954, 1000=0.00750 (USD); Mount: Surface Mount; Case/Package: 0603; Case Code (Metric): 1608; Case Code (Imperial): 0603; Contact Plating: Tin; Min Operating Temperature: -55°C; Max Operating Temperature: 125°C; Dielectric: X7R; Voltage Rating: 50V; Package Quantity: 1; Packaging: Tape and Reel; Voltage: 50V; Voltage Rating (DC): 50V; Series: CL; Construction: Flat; Length: 1.6mm; Width: 0.031inch; Height: 0.8mm; Depth: 0.8mm; Thickness: 0.035inch; Radiation Hardening: No; Lead Free: Lead Free; RoHS Compliant: Yes; ComponentLink1URL: https://datasheet.ciiva.com/25803/cl10b104kb8nnnc-25803393.pdf?src-supplier=Digi-Key; ComponentLink1Description: https://datasheet.ciiva.com/25803/cl10b104kb8nnnc-25803393.pdf?src-supplier=Digi-Key; ComponentLink2URL: https://datasheet.ciiva.com/26838/getdatasheetpartid-89097-26838411.pdf?src-supplier=Verical; ComponentLink2Description: https://datasheet.ciiva.com/26838/getdatasheetpartid-89097-26838411.pdf?src-supplier=Verical; ComponentLink3URL: https://datasheet.ciiva.com/29198/456651-da-01-en-vs-kondensator-0605-29198839.pdf?src-supplier=Conrad; ComponentLink3Description: https://datasheet.ciiva.com/29198/456651-da-01-en-vs-kondensator-0605-29198839.pdf?src-supplier=Conrad; Supplier Part Number 1: 1276-1000-1-ND; LCSC Part Number: C1591
C37 C38 = CC0603KRX5R8BB105: CAP CER 1UF 25V X5R 0603; Manufacturer: Yageo; Tolerance: 10%; Item Type: Capacitor; Supplier 1: Digi-Key; Manufacturer Part Number: CC0603KRX5R8BB105; RoHS: Yes; Category: Ceramic Capacitors; Stock 1: 919939; Pricing 1: 1=0.12000, 10=0.08400, 50=0.04760, 100=0.03940, 500=0.02764, 1000=0.02288 (USD); Mount: Surface Mount; Case/Package: 0603; Number of Pins: 2; Case Code (Metric): 1608; Case Code (Imperial): 0603; Min Operating Temperature: -55°C; Max Operating Temperature: 85°C; Capacitance: 1uF; Dielectric: X5R; Package Quantity: 1; Voltage Rating: 25V; Packaging: Tape and Reel; Termination: SMD/SMT; Voltage Rating (DC): 25V; Series: CC; Construction: Flat; Length: 1.6mm; Width: 0.031inch; Height: 0.8mm; Thickness: 0.035inch; Depth: 0.8mm; Radiation Hardening: No; REACH SVHC: No SVHC; Lead Free: Lead Free; Halogen Free: Halogen Free; RoHS Compliant: Yes; ComponentLink1URL: https://datasheet.ciiva.com/176/mlccorderingcode-176785.pdf?src-supplier=Digi-Key; ComponentLink1Description: https://datasheet.ciiva.com/176/mlccorderingcode-176785.pdf?src-supplier=Digi-Key; ComponentLink2URL: https://datasheet.ciiva.com/176/mlccorderingcode-176786.pdf?src-supplier=Digi-Key; ComponentLink2Description: https://datasheet.ciiva.com/176/mlccorderingcode-176786.pdf?src-supplier=Digi-Key; ComponentLink3URL: https://datasheet.ciiva.com/176/mlccorderingcode-176787.pdf?src-supplier=Digi-Key; ComponentLink3Description: https://datasheet.ciiva.com/176/mlccorderingcode-176787.pdf?src-supplier=Digi-Key; ComponentLink4URL: https://datasheet.ciiva.com/17436/upy-gphc-x5r-4v-to-50v-12-17436952.pdf?src-supplier=Avnet+Europe; ComponentLink4Description: https://datasheet.ciiva.com/17436/upy-gphc-x5r-4v-to-50v-12-17436952.pdf?src-supplier=Avnet+Europe; ComponentLink5URL: https://datasheet.ciiva.com/7978/1525783-7978171.pdf?src-supplier=Element14; ComponentLink5Description: https://datasheet.ciiva.com/7978/1525783-7978171.pdf?src-supplier=Element14; ComponentLink6URL: https://datasheet.ciiva.com/11586/upy-gphc-x5r-4v-to-50v-12-11586318.pdf?src-supplier=Avnet; ComponentLink6Description: https://datasheet.ciiva.com/11586/upy-gphc-x5r-4v-to-50v-12-11586318.pdf?src-supplier=Avnet; Supplier Part Number 1: 311-1445-1-ND; LCSC Part Number: C14664
P30-P33 = TEST POINT: Test Point ON; Item Type: TEST POINT; Manufacturer Part Number: TEST POINT
R25 = RTT031202BTP: 12kΩ 0603 Chip Resistor - Surface Mount ROHS; Manufacturer: RALEC; Manufacturer Part Number: RTT031202BTP; Footprint: 0603; ComponentLink1Description: LCSC; ComponentLink1URL: https://lcsc.com/product-detail/Chip-span-style-background-color-ff0-Resistor-span-Surface-Mount_RALEC-RTT031202BTP_C2981490.html; LCSC Part Number: C2981490
R26-R28 = RT0603BRD0750KL: RES 50K OHM 0.1% 1/10W 0603; Manufacturer: Yageo; Value: 50kR; Max Power Dissipation: 100mW; Temperature Coefficient: 25ppm/°C; Voltage Rating: 75V; Item Type: Resistor; Supplier: Future Electronics; Supplier Part Number: 3072856; Manufacturer Part Number: RT0603BRD0750KL; RoHS: No; Category: Chip SMD Resistors; Stock: 70000; Pricing: 5000=0.0213, 15000=0.0206, 25000=0.0211, 50000=0.0198, 100000=0.0194, 200000=0.0186 (USD); Case/Package: 0603; Min Operating Temperature: -55°C; Max Operating Temperature: 155°C; Series: RT; Packaging: Tape and Reel; Tolerance: 0.1%; Number of Terminations: 2; Power Rating: 100mW; Height: 550um; ComponentLink1URL: https://www.yageo.com/upload/media/product/productsearch/datasheet/rchip/PYu-RT_1-to-0.01_RoHS_L_12.pdf?src-supplier=Digikey; ComponentLink1Description: https://www.yageo.com/upload/media/product/productsearch/datasheet/rchip/PYu-RT_1-to-0.01_RoHS_L_12.pdf?src-supplier=Digikey; LCSC Part Number: C861451
U5 = USB2422/MJ: Hub Controller USB QFN-24-EP(4x4) USB ICs ROHS; Manufacturer: Microchip; Item Type: IC; Supplier: Avnet; Supplier Part Number: USB2422/MJ; Manufacturer Part Number: USB2422/MJ; RoHS: Yes; Category: USB Interface ICs; Stock: 330; Pricing: 490=1.5 (USD); ComponentLink1URL: http://components.arrow.com/part/dataview/58768923S663889N2064?src-supplier=Arrow+Electronics; ComponentLink1Description: http://components.arrow.com/part/dataview/58768923S663889N2064?src-supplier=Arrow+Electronics; ComponentLink2URL: http://www.mouser.com/ds/2/268/2422-319423.pdf?src-supplier=Mouser; ComponentLink2Description: http://www.mouser.com/ds/2/268/2422-319423.pdf?src-supplier=Mouser; ComponentLink3URL: http://www.microchip.com/mymicrochip/filehandler.aspx?ddocname=en566992&src-supplier=Digikey; ComponentLink3Description: http://www.microchip.com/mymicrochip/filehandler.aspx?ddocname=en566992&src-supplier=Digikey; ComponentLink4URL: https://datasheet.octopart.com/USB2422-MJ-Microchip-datasheet-42223901.pdf?src-supplier=Future+Electronics; ComponentLink4Description: https://datasheet.octopart.com/USB2422-MJ-Microchip-datasheet-42223901.pdf?src-supplier=Future+Electronics; LCSC Part Number: C633330
U6 = BL-R8812AF1: Intelligent WiFiI Module 1200M Dual Band+AC (High Power); Manufacturer: *; Manufacturer Part Number: BL-R8812AF1; ComponentLink1Description: Aliexpress; ComponentLink1URL: https://www.aliexpress.com/item/1005005638445796.html?spm=a2g0o.order_list.order_list_main.29.65f179d27FZF0V&gatewayAdapt=glo2nld; Item Type: Module
X3 = MCSJK-7U-24.00-12-10-60-B-10: Crystal, 24Mhz, 12Pf, 3.2Mm X 2.5Mm; Manufacturer: Multicomp; Supplier: Newark; Supplier Part Number: 56AC8946; Manufacturer Part Number: MCSJK-7U-24.00-12-10-60-B-10; RoHS: No; Stock: 5313; Pricing: 5=0.328, 250=0.253, 500=0.227, 1000=0.207, 5000=0.189 (USD); Item Type: Crystal

## Nets that join several sheets
+3V3: Connector_Section (J1.21 J1.22 J1.23), Controller_Section (16 pins), FlashMemory_Section (C32.2 C33.2 R21.2 U4.8), Power_Section (6 pins), WiFiModule_Section (8 pins)
+5V: Connector_Section (13 pins), Power_Section (8 pins)
GND: Connector_Section (62 pins), Controller_Section (18 pins), FlashMemory_Section (5 pins), Power_Section (31 pins), WiFiModule_Section (17 pins)
VBAT: Connector_Section (6 pins), Power_Section (13 pins)
VOXL_EN_BUCK: Connector_Section (J3.07), Power_Section (5 pins)
D_N: Controller_Section (R18.2), WiFiModule_Section (U5.4)
D_P: Controller_Section (R20.2), WiFiModule_Section (U5.5)
GPIO7: Connector_Section (R23.2), Controller_Section (U3.9)
GPIO8_TX1: Controller_Section (U3.11), WiFiModule_Section (P30.1)
GPIO9_RX1: Controller_Section (U3.12), WiFiModule_Section (P31.1)
GPIO12: Connector_Section (J1.14), Controller_Section (U3.15)
GPIO17: Controller_Section (U3.28), Power_Section (D1.2)
GPIO22: Controller_Section (U3.34), Power_Section (D6.2 P22.1)
GPIO23: Controller_Section (U3.35), Power_Section (D7.2 P21.1)
GPIO24: Controller_Section (U3.36), Power_Section (C18.2 D2.2)
QSPI_SD0: Controller_Section (U3.53), FlashMemory_Section (U4.5)
QSPI_SD1: Controller_Section (U3.55), FlashMemory_Section (U4.2)
QSPI_SD2: Controller_Section (U3.54), FlashMemory_Section (U4.3)
QSPI_SD3: Controller_Section (U3.51), FlashMemory_Section (U4.7)
QSPI_SLCK: Controller_Section (U3.52), FlashMemory_Section (U4.6)
QSPI_SS: Controller_Section (U3.56), FlashMemory_Section (R21.1 R22.2 U4.1)
SBUS_TX: Connector_Section (J1.13 P29.1), Controller_Section (U3.16)
SCL0: Connector_Section (J1.18 P28.1), Controller_Section (U3.32)
SCL_VOXL: Connector_Section (J3.13), Controller_Section (U3.18)
SDA0: Connector_Section (J1.17 P27.1), Controller_Section (U3.31)
SDA_VOXL: Connector_Section (J3.15), Controller_Section (U3.17)
SW1: Connector_Section (J1.11), Power_Section (P3.1 R29.1)
VOXL_USB_N: Connector_Section (J3.12), WiFiModule_Section (U5.19)
VOXL_USB_P: Connector_Section (J3.14), WiFiModule_Section (U5.20)